# Altium project Octopus_Ribbon_PCB.PrjPcb
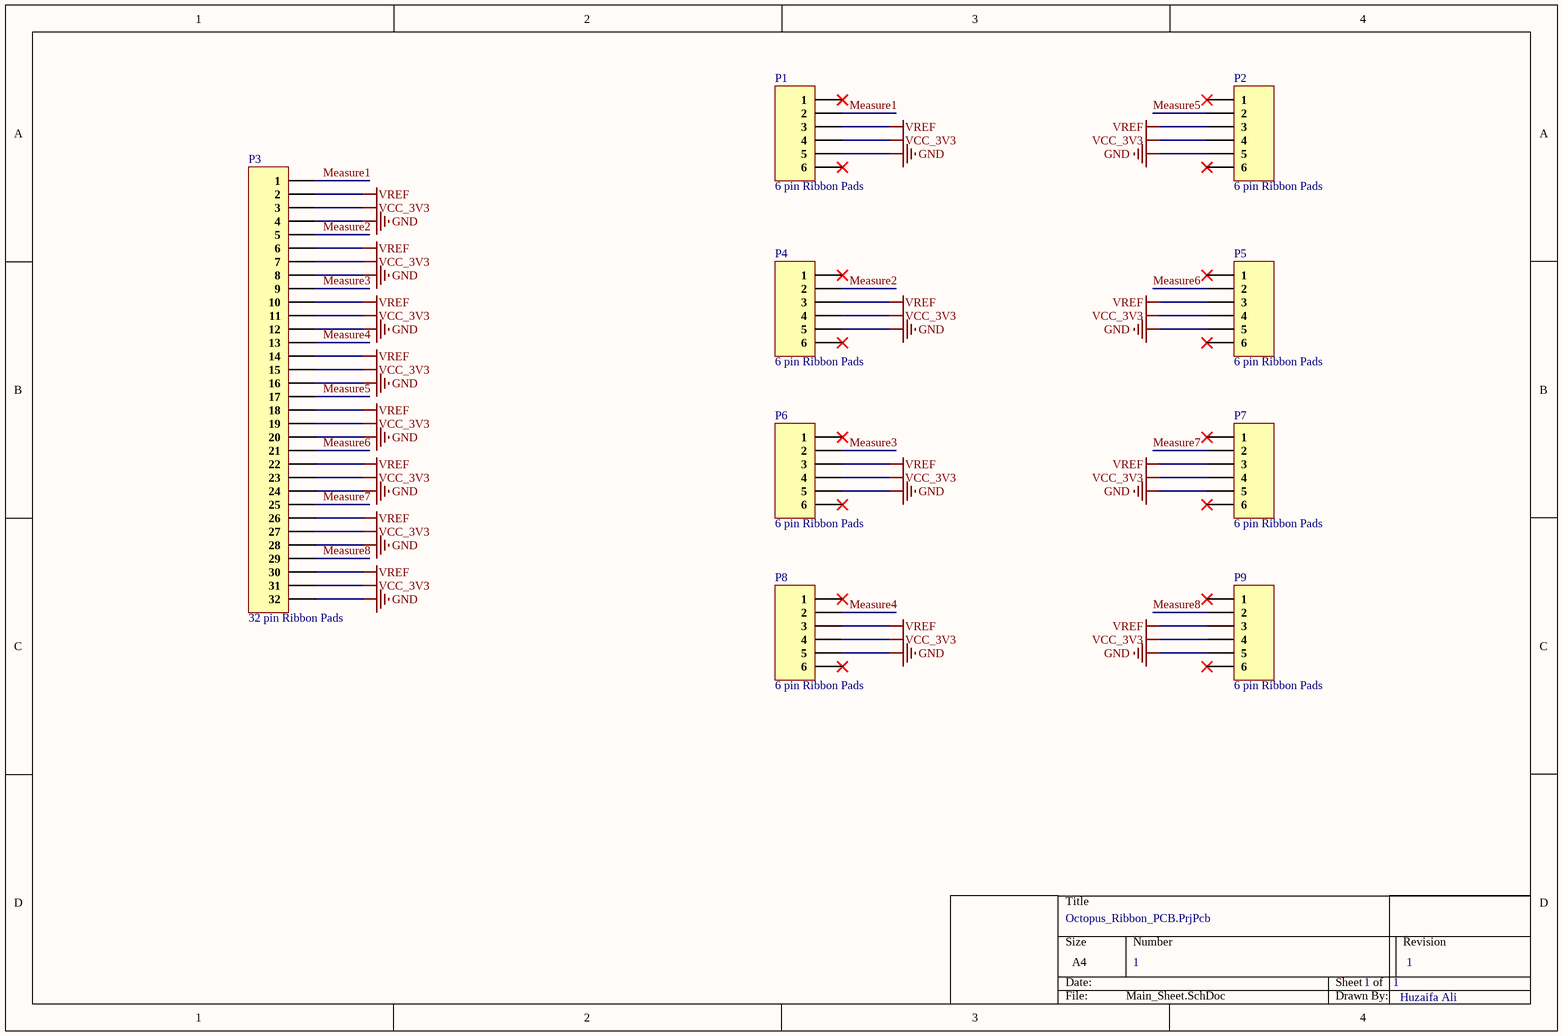
[diagram p0: Main_Sheet.SchDoc]
1 sheet, 9 parts. Net scope: global (net labels, ports and power ports of the same name join across sheets).
Board file: Oct_Ribbon_V2.1_PCB.PcbDoc

## Sheet Main_Sheet.SchDoc: =Projectname
size A4; SheetNumber: 1; SheetTotal: 1

### Parts
P1  6 pin Ribbon Pads  [6 pin Ribbon Pads.]
P2  6 pin Ribbon Pads  [6 pin Ribbon Pads.]
P3  32 pin Ribbon Pads  [32 pin Ribbon Pads.]
P4  6 pin Ribbon Pads  [6 pin Ribbon Pads.]
P5  6 pin Ribbon Pads  [6 pin Ribbon Pads.]
P6  6 pin Ribbon Pads  [6 pin Ribbon Pads.]
P7  6 pin Ribbon Pads  [6 pin Ribbon Pads.]
P8  6 pin Ribbon Pads  [6 pin Ribbon Pads.]
P9  6 pin Ribbon Pads  [6 pin Ribbon Pads.]

### Nets
GND: P1.5 P2.5 P3.4 P3.8 P3.12 P3.16 P3.20 P3.24 P3.28 P3.32 P4.5 P5.5 P6.5 P7.5 P8.5 P9.5
VCC_3V3: P1.4 P2.4 P3.3 P3.7 P3.11 P3.15 P3.19 P3.23 P3.27 P3.31 P4.4 P5.4 P6.4 P7.4 P8.4 P9.4
VREF: P1.3 P2.3 P3.2 P3.6 P3.10 P3.14 P3.18 P3.22 P3.26 P3.30 P4.3 P5.3 P6.3 P7.3 P8.3 P9.3
Measure1: P1.2 P3.1
Measure2: P3.5 P4.2
Measure3: P3.9 P6.2
Measure4: P3.13 P8.2
Measure5: P2.2 P3.17
Measure6: P3.21 P5.2
Measure7: P3.25 P7.2
Measure8: P3.29 P9.2

Not connected (* = marked no-connect by the designer): P1 1* 6*; P2 1* 6*; P4 1* 6*; P5 1* 6*; P6 1* 6*; P7 1* 6*; P8 1* 6*; P9 1* 6*

### Notes on the sheet
- 1
- Huzaifa Ali

### Library data of the parts
P1 P2 P4-P9 = 6 pin Ribbon Pads: Ribbon wire Connection Pads
P3 = 32 pin Ribbon Pads: Ribbon wire Connection Pads